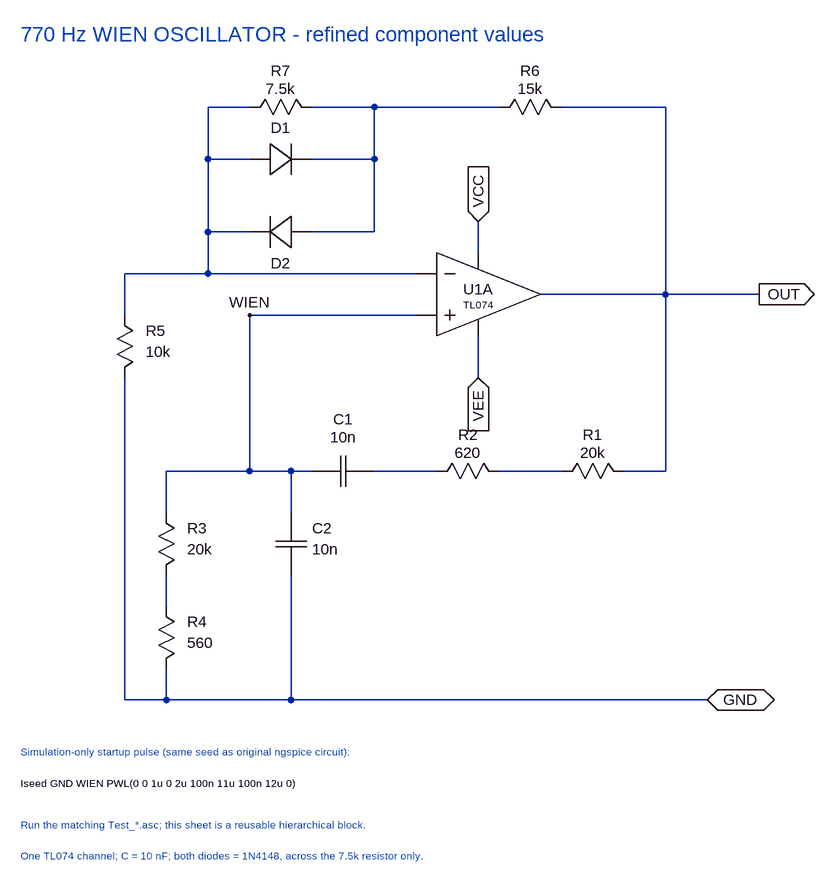
[diagram p0: schematic LowOscillator.asc]
LowOscillator.asc, the LTspice schematic file:
Version 4
SHEET 1 1344 1328
WIRE 864 416 1056 416
WIRE 1056 416 1200 416
WIRE 1056 416 1056 128
WIRE 1056 128 896 128
WIRE 800 128 608 128
WIRE 608 128 512 128
WIRE 416 128 352 128
WIRE 352 128 352 208
WIRE 352 208 352 320
WIRE 352 320 352 384
WIRE 352 384 672 384
WIRE 352 208 416 208
WIRE 512 208 608 208
WIRE 352 320 416 320
WIRE 512 320 608 320
WIRE 608 128 608 208
WIRE 608 208 608 320
WIRE 352 384 224 384
WIRE 224 384 224 448
WIRE 224 544 224 1040
WIRE 1056 416 1056 688
WIRE 1056 688 992 688
WIRE 896 688 800 688
WIRE 704 688 608 688
WIRE 512 688 480 688
WIRE 480 688 416 688
WIRE 416 688 288 688
WIRE 288 688 288 752
WIRE 416 688 416 448
WIRE 416 448 672 448
WIRE 288 848 288 896
WIRE 288 992 288 1040
WIRE 480 688 480 752
WIRE 480 848 480 1040
WIRE 224 1040 288 1040
WIRE 288 1040 480 1040
WIRE 480 1040 1120 1040
WIRE 768 352 768 304
WIRE 768 480 768 544
FLAG 1200 416 OUT
FLAG 416 448 WIEN
FLAG 1120 1040 GND
FLAG 768 304 VCC
FLAG 768 544 VEE
IOPIN 1200 416 Out
IOPIN 1120 1040 BiDir
IOPIN 768 304 In
IOPIN 768 544 In
SYMBOL TL074_Channel 672 352 R0
SYMATTR InstName U1A
SYMBOL R_H 800 128 R0
SYMATTR InstName R6
SYMATTR Value 15k
SYMBOL R_H 416 128 R0
SYMATTR InstName R7
SYMATTR Value 7.5k
SYMBOL Diode_1N4148 416 208 R0
SYMATTR InstName D1
SYMBOL Diode_1N4148 512 320 R180
SYMATTR InstName D2
SYMBOL R_V 224 448 R0
SYMATTR InstName R5
SYMATTR Value 10k
SYMBOL R_H 896 688 R0
SYMATTR InstName R1
SYMATTR Value 20k
SYMBOL R_H 704 688 R0
SYMATTR InstName R2
SYMATTR Value 620
SYMBOL C_H 512 688 R0
SYMATTR InstName C1
SYMATTR Value 10n
SYMBOL R_V 288 752 R0
SYMATTR InstName R3
SYMATTR Value 20k
SYMBOL R_V 288 896 R0
SYMATTR InstName R4
SYMATTR Value 560
SYMBOL C_V 480 752 R0
SYMATTR InstName C2
SYMATTR Value 10n
TEXT 64 16 Left 3 ;770 Hz WIEN OSCILLATOR - refined component values
TEXT 64 1280 Left 1 ;One TL074 channel; C = 10 nF; both diodes = 1N4148, across the 7.5k resistor only.
TEXT 64 1120 Left 1 ;Simulation-only startup pulse (same seed as original ngspice circuit):
TEXT 64 1168 Left 1 !Iseed GND WIEN PWL(0 0 1u 0 2u 100n 11u 100n 12u 0)
TEXT 64 1232 Left 1 ;Run the matching Test_*.asc; this sheet is a reusable hierarchical block.

The netlist it stands for:
* LowOscillator.asc
XU1A WIEN N002 VCC VEE OUT TL074  ; pins IN+ IN- VCC VEE OUT
R6 N001 OUT 15k
R7 N002 N001 7.5k
XD1 N002 N001 1N4148  ; pins A K
XD2 N001 N002 1N4148  ; pins A K
R5 N002 GND 10k
R1 N003 OUT 20k
R2 N004 N003 620
C1 WIEN N004 10n
R3 WIEN N005 20k
R4 N005 GND 560
C2 WIEN GND 10n
* 770 Hz WIEN OSCILLATOR - refined component values
* One TL074 channel; C = 10 nF; both diodes = 1N4148, across the 7.5k resistor only.
* Simulation-only startup pulse (same seed as original ngspice circuit):
Iseed GND WIEN PWL(0 0 1u 0 2u 100n 11u 100n 12u 0)
* Run the matching Test_*.asc; this sheet is a reusable hierarchical block.
.backanno
.end